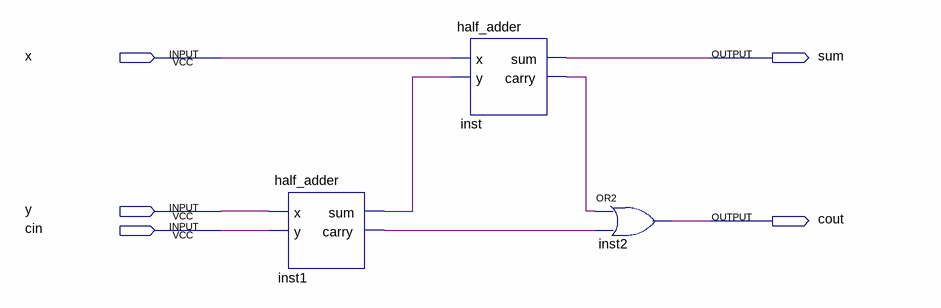
[diagram p0: schematic sheet]
// Quartus schematic full_adder.bdf as structural Verilog: 3 symbols, 5 pins
module full_adder (
  input  x,
  input  y,
  input  cin,
  output sum,
  output cout
);

  wire inst1_carry, inst1_sum, inst_carry;

  half_adder inst1 (.x(y), .y(cin), .sum(inst1_sum), .carry(inst1_carry));
  half_adder inst (.x(x), .y(inst1_sum), .sum(sum), .carry(inst_carry));
  or inst2 (cout, inst_carry, inst1_carry);
endmodule
